# Altium schematic sheet 02 Connector.SchDoc
size A1; Revision: V1.2; SheetNumber: 2; SheetTotal: 11
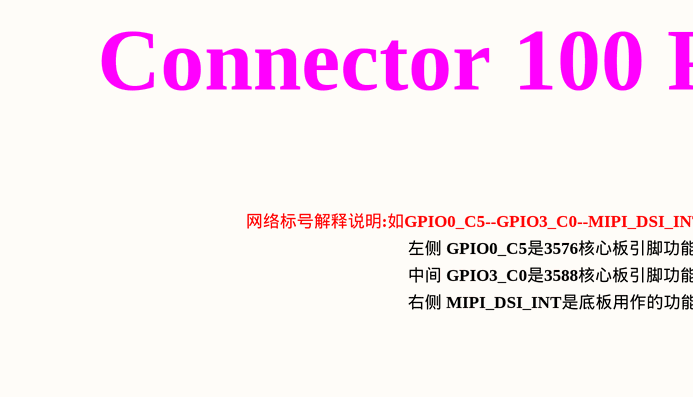
[diagram p0: 02 Connector.SchDoc, top left]
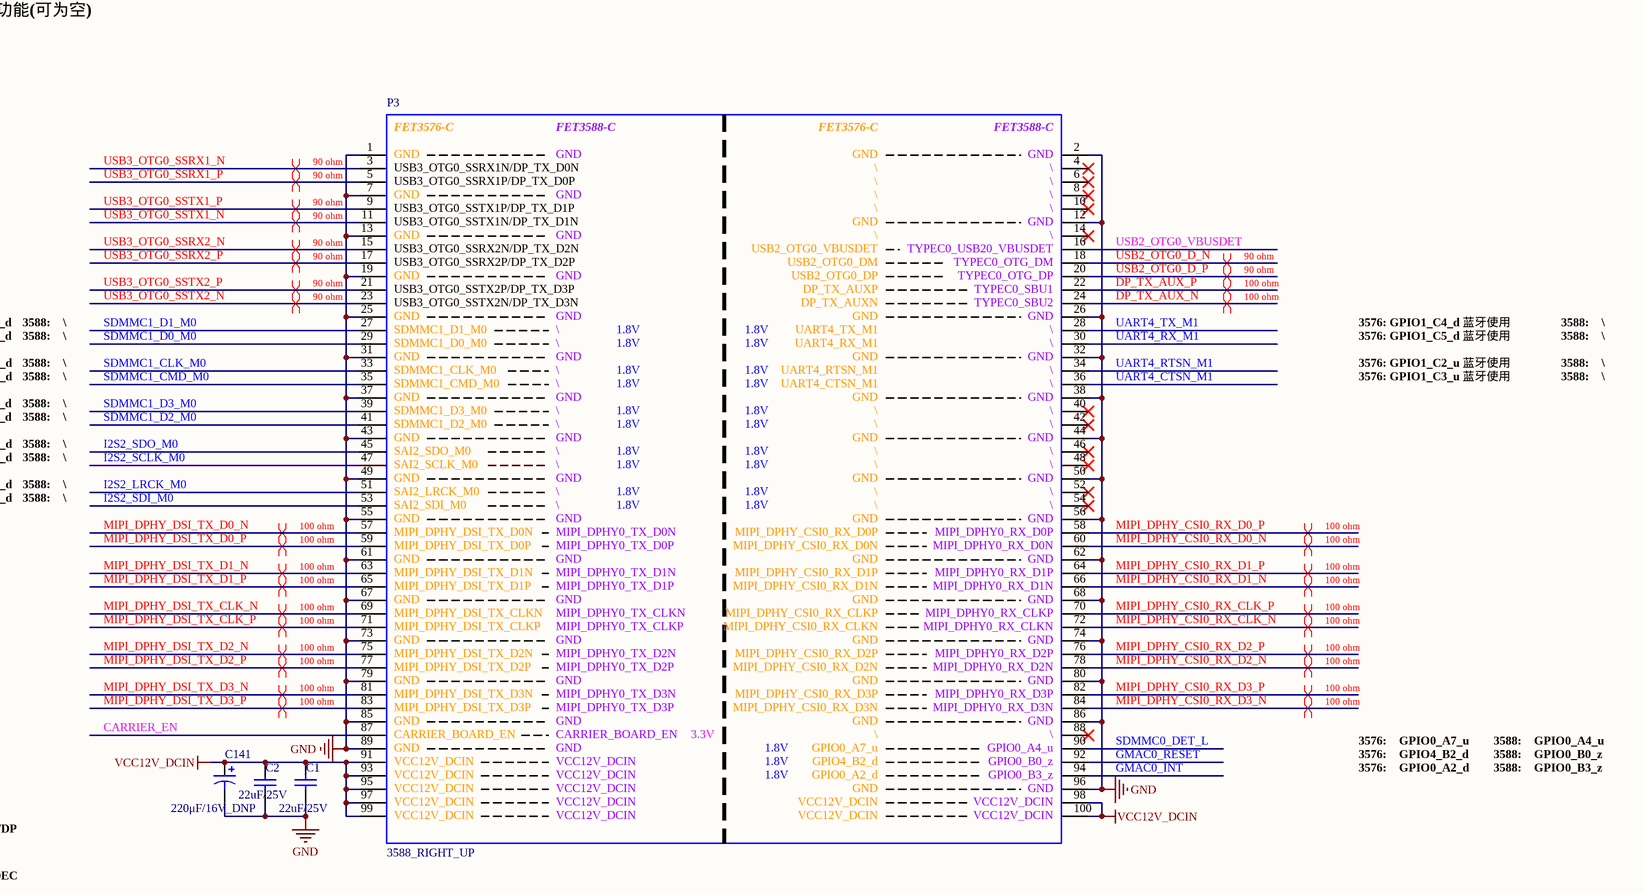
[diagram p1: 02 Connector.SchDoc, top right]
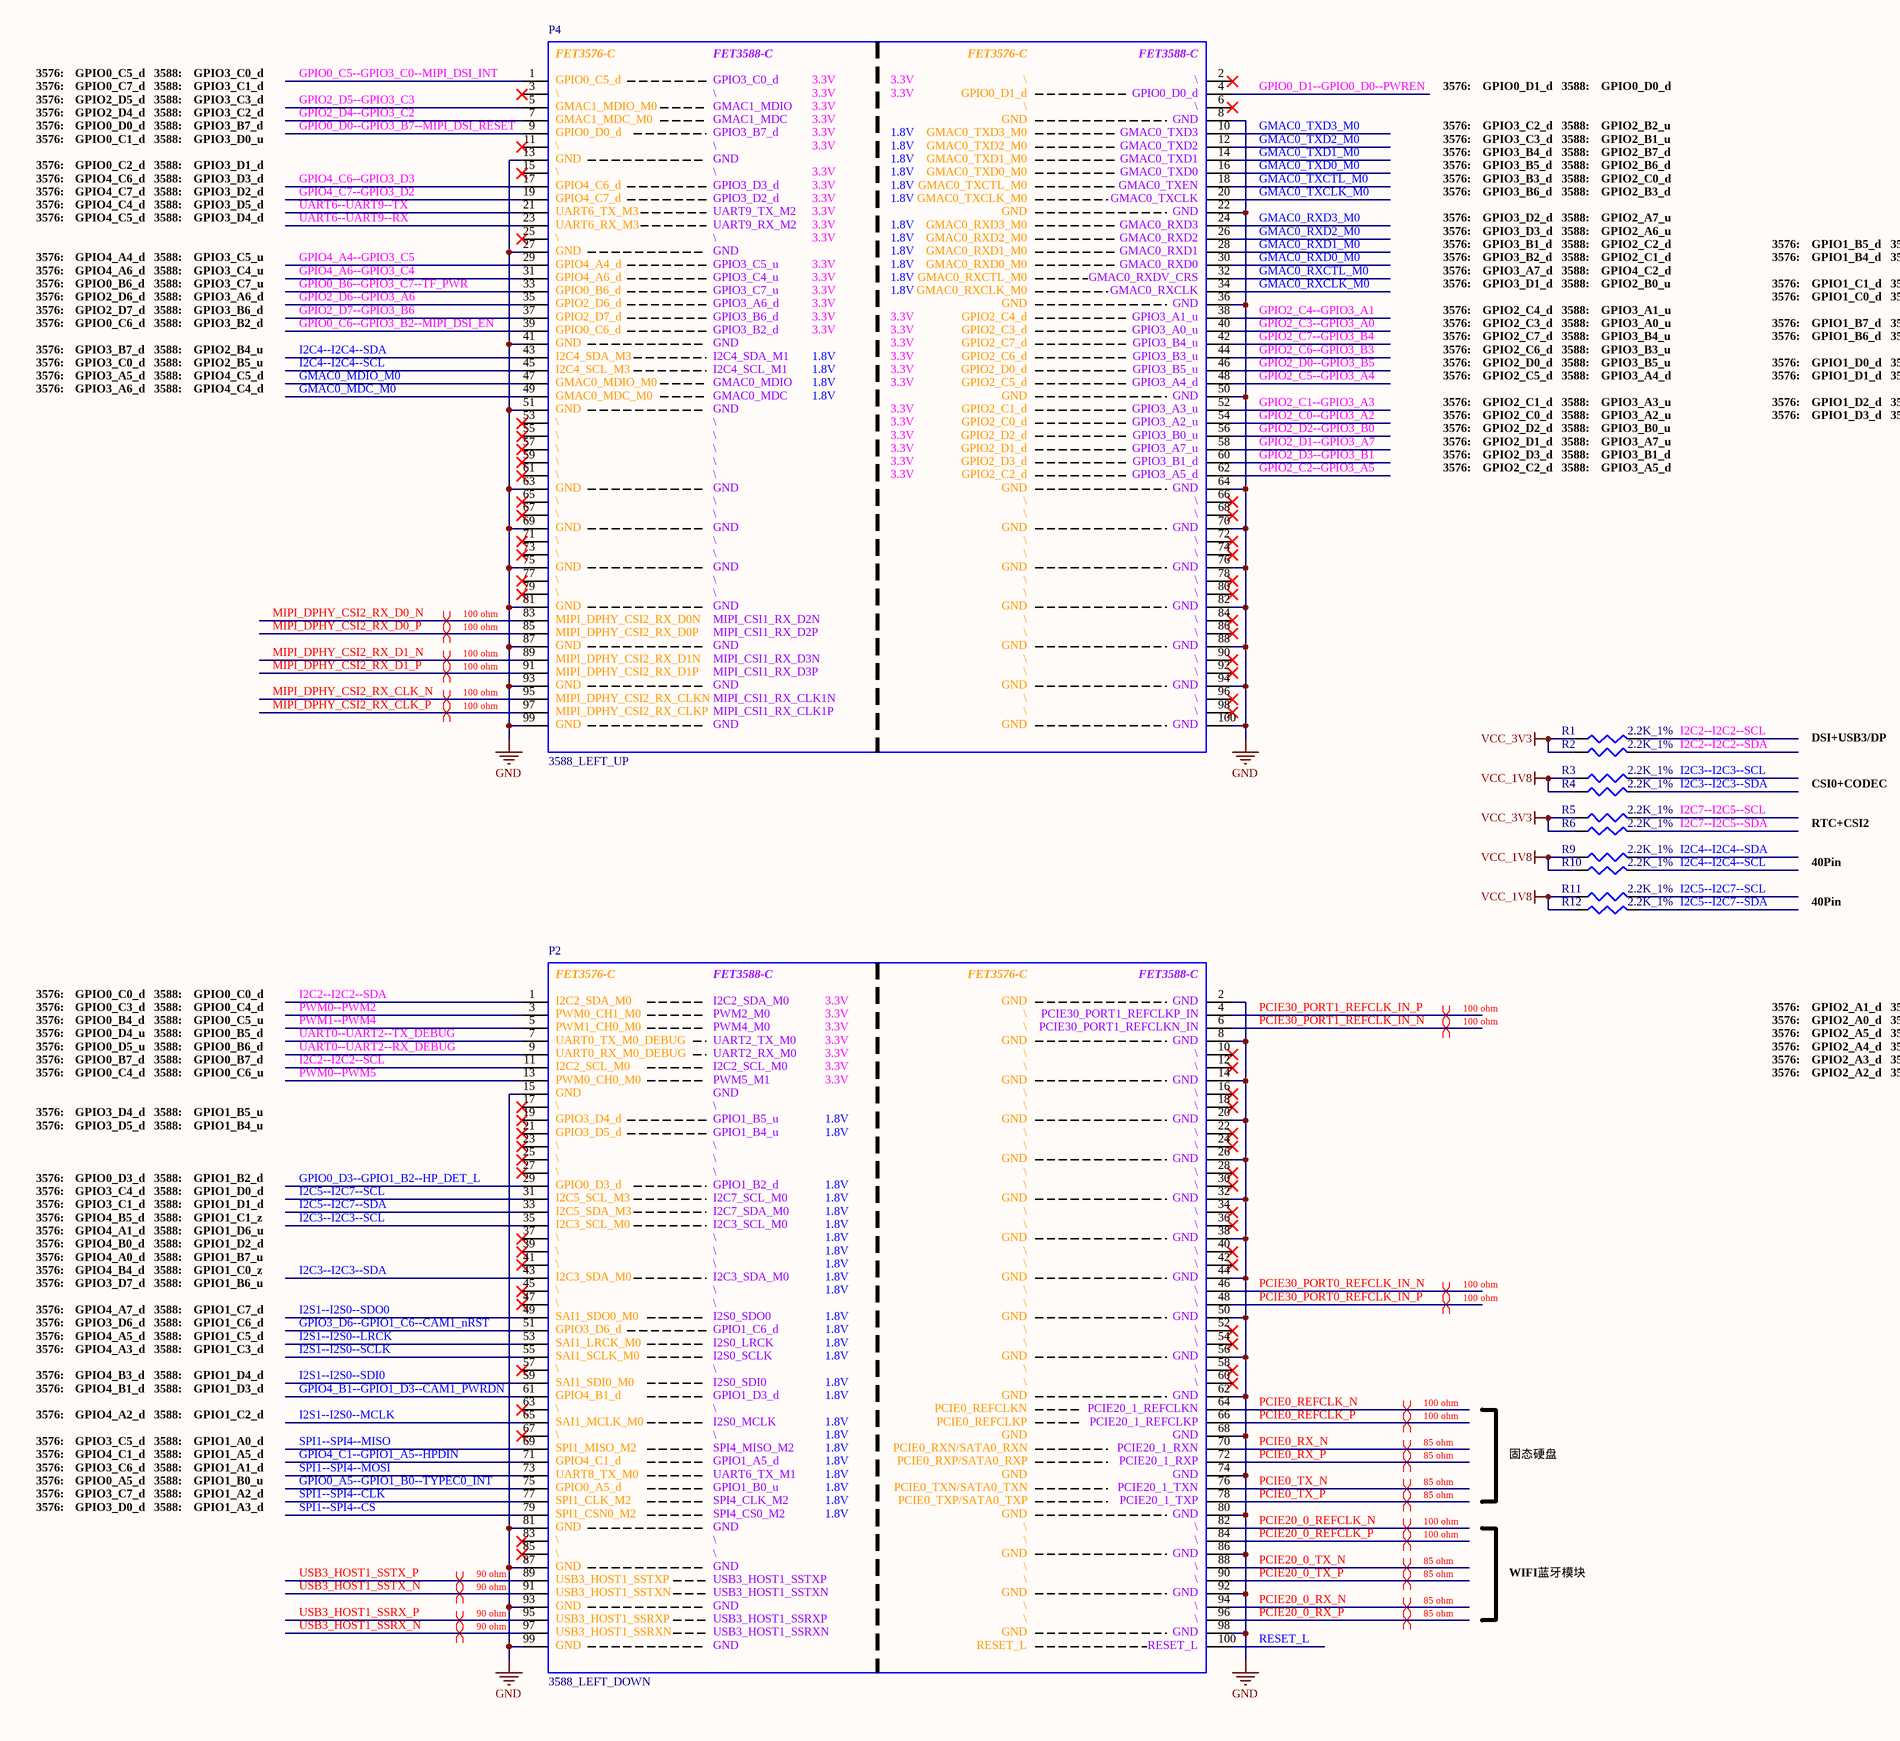
[diagram p2: 02 Connector.SchDoc, bottom left]
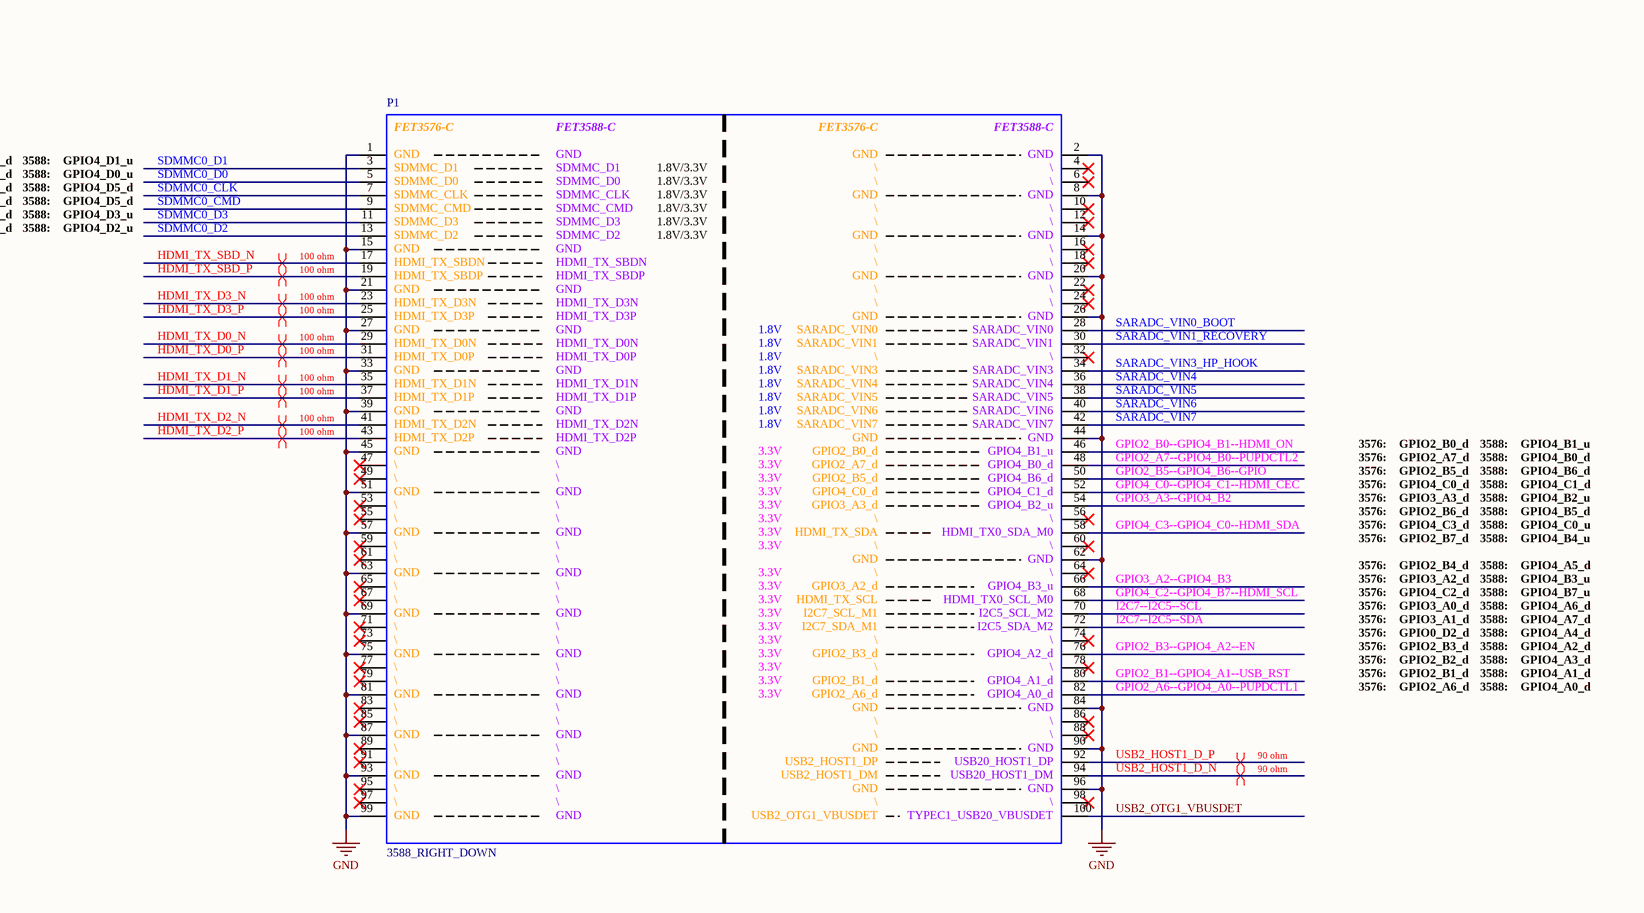
[diagram p3: 02 Connector.SchDoc, bottom right]

## Parts
C1  22uF/25V  [1206C]
C2  22uF/25V  [1206C]
C141  220μF/16V_DNP  [CAP SMT_6.3x7.7]
P1  3588_RIGHT_DOWN  [SOCKET_100PIN_0.4MM_F]
P2  3588_LEFT_DOWN  [SOCKET_100PIN_0.4MM_F]
P3  3588_RIGHT_UP  [SOCKET_100PIN_0.4MM_F]
P4  3588_LEFT_UP  [SOCKET_100PIN_0.4MM_F]
R1  2.2K_1%  [0402R]
R2  2.2K_1%  [0402R]
R3  2.2K_1%  [0402R]
R4  2.2K_1%  [0402R]
R5  2.2K_1%  [0402R]
R6  2.2K_1%  [0402R]
R9  2.2K_1%  [0402R]
R10  2.2K_1%  [0402R]
R11  2.2K_1%  [0402R]
R12  2.2K_1%  [0402R]

## Nets
GND: C1.1 C2.1 C141.2 P1.1(GND) P1.2(GND) P1.8(GND) P1.14(GND) P1.15(GND) P1.20(GND) P1.21(GND) P1.26(GND) P1.27(GND) P1.33(GND) P1.39(GND) P1.44(GND) P1.45(GND) P1.51(GND) P1.57(GND) P1.62(GND) P1.63(GND) P1.69(GND) P1.75(GND) P1.81(GND) P1.84(GND) P1.87(GND) P1.90(GND) P1.93(GND) P1.96(GND) P1.99(GND) P2.2(GND) P2.8(GND) P2.14(GND) P2.15(GND) P2.20(GND) P2.26(GND) P2.32(GND) P2.38(GND) P2.44(GND) P2.50(GND) P2.56(GND) P2.62(GND) P2.68(GND) P2.74(GND) P2.80(GND) P2.81(GND) P2.86(GND) P2.87(GND) P2.92(GND) P2.93(GND) P2.98(GND) P2.99(GND) P3.1(GND) P3.2(GND) P3.7(GND) P3.12(GND) P3.13(GND) P3.19(GND) P3.25(GND) P3.26(GND) P3.31(GND) P3.32(GND) P3.37(GND) P3.38(GND) P3.43(GND) P3.44(GND) P3.49(GND) P3.50(GND) P3.55(GND) P3.56(GND) P3.61(GND) P3.62(GND) P3.67(GND) P3.68(GND) P3.73(GND) P3.74(GND) P3.79(GND) P3.80(GND) P3.85(GND) P3.86(GND) P3.89(GND) P3.96(GND) P4.8(GND) P4.13(GND) P4.22(GND) P4.27(GND) P4.36(GND) P4.41(GND) P4.50(GND) P4.51(GND) P4.63(GND) P4.64(GND) P4.69(GND) P4.70(GND) P4.75(GND) P4.76(GND) P4.81(GND) P4.82(GND) P4.87(GND) P4.88(GND) P4.93(GND) P4.94(GND) P4.99(GND) P4.100(GND)
VCC12V_DCIN: C1.2 C2.2 C141.1 P3.91(VCC12V_DCIN) P3.93(VCC12V_DCIN) P3.95(VCC12V_DCIN) P3.97(VCC12V_DCIN) P3.98(VCC12V_DCIN) P3.99(VCC12V_DCIN) P3.100(VCC12V_DCIN)
VCC_1V8: R3.1 R4.1 R9.1 R10.1 R11.1 R12.1
VCC_3V3: R1.1 R2.1 R5.1 R6.1
CARRIER_EN: P3.87(CARRIER_BOARD_EN)
DP_TX_AUX_N: P3.24(DP_TX_AUXN)
DP_TX_AUX_P: P3.22(DP_TX_AUXP)
GMAC0_INT: P3.94(GPIO0_A2_d)
GMAC0_MDC_M0: P4.49(GMAC0_MDC_M0)
GMAC0_MDIO_M0: P4.47(GMAC0_MDIO_M0)
GMAC0_RESET: P3.92(GPIO4_B2_d)
GMAC0_RXCLK_M0: P4.34(GMAC0_RXCLK_M0)
GMAC0_RXCTL_M0: P4.32(GMAC0_RXCTL_M0)
GMAC0_RXD0_M0: P4.30(GMAC0_RXD0_M0)
GMAC0_RXD1_M0: P4.28(GMAC0_RXD1_M0)
GMAC0_RXD2_M0: P4.26(GMAC0_RXD2_M0)
GMAC0_RXD3_M0: P4.24(GMAC0_RXD3_M0)
GMAC0_TXCLK_M0: P4.20(GMAC0_TXCLK_M0)
GMAC0_TXCTL_M0: P4.18(GMAC0_TXCTL_M0)
GMAC0_TXD0_M0: P4.16(GMAC0_TXD0_M0)
GMAC0_TXD1_M0: P4.14(GMAC0_TXD1_M0)
GMAC0_TXD2_M0: P4.12(GMAC0_TXD2_M0)
GMAC0_TXD3_M0: P4.10(GMAC0_TXD3_M0)
GPIO0_A5--GPIO1_B0--TYPEC0_INT: P2.75(GPIO0_A5_d)
GPIO0_B6--GPIO3_C7--TF_PWR: P4.33(GPIO0_B6_d)
GPIO0_C5--GPIO3_C0--MIPI_DSI_INT: P4.1(GPIO0_C5_d)
GPIO0_C6--GPIO3_B2--MIPI_DSI_EN: P4.39(GPIO0_C6_d)
GPIO0_D0--GPIO3_B7--MIPI_DSI_RESET: P4.9(GPIO0_D0_d)
GPIO0_D1--GPIO0_D0--PWREN: P4.4(GPIO0_D1_d)
GPIO0_D3--GPIO1_B2--HP_DET_L: P2.29(GPIO0_D3_d_1V8)
GPIO2_A6--GPIO4_A0--PUPDCTL1: P1.82(TYPEC_DPTX_AUX_PUPDCTL1)
GPIO2_A7--GPIO4_B0--PUPDCTL2: P1.48(TYPEC_DPTX_AUX_PUPDCTL2)
GPIO2_B0--GPIO4_B1--HDMI_ON: P1.46(HDMI_TX_ON_H)
GPIO2_B1--GPIO4_A1--USB_RST: P1.80(GPIO2_B1_d)
GPIO2_B3--GPIO4_A2--EN: P1.76(GPIO2_B3_d)
GPIO2_B5--GPIO4_B6--GPIO: P1.50(GPIO2_B5_d)
GPIO2_C0--GPIO3_A2: P4.54(GMAC1_RXD2_M0)
GPIO2_C1--GPIO3_A3: P4.52(GMAC1_RXD3_M0)
GPIO2_C2--GPIO3_A5: P4.62(GMAC1_RXCLK_M0)
GPIO2_C3--GPIO3_A0: P4.40(GMAC1_TXD2_M0)
GPIO2_C4--GPIO3_A1: P4.38(GMAC1_TXD3_M0)
GPIO2_C5--GPIO3_A4: P4.48(GMAC1_TXCLK_M0)
GPIO2_C6--GPIO3_B3: P4.44(GMAC1_TXD0_M0)
GPIO2_C7--GPIO3_B4: P4.42(GMAC1_TXD1_M0)
GPIO2_D0--GPIO3_B5: P4.46(GMAC1_TXCTL_M0)
GPIO2_D1--GPIO3_A7: P4.58(GMAC1_RXD0_M0)
GPIO2_D2--GPIO3_B0: P4.56(GMAC1_RXD1_M0)
GPIO2_D3--GPIO3_B1: P4.60(GMAC1_RXCTL_M0)
GPIO2_D4--GPIO3_C2: P4.7(GMAC1_MDC_M0)
GPIO2_D5--GPIO3_C3: P4.5(GMAC1_MDIO_M0)
GPIO2_D6--GPIO3_A6: P4.35(ETH_CLK1_25M_OUT_M0)
GPIO2_D7--GPIO3_B6: P4.37(ETH1_MCLK_M0)
GPIO3_A2--GPIO4_B3: P1.66(CAN1_TX_M3)
GPIO3_A3--GPIO4_B2: P1.54(CAN1_RX_M3)
GPIO3_D6--GPIO1_C6--CAM1_nRST: P2.51(GPIO3_D6_d)
GPIO4_A4--GPIO3_C5: P4.29(CAN0_TX_M2_3V3)
GPIO4_A6--GPIO3_C4: P4.31(CAN0_RX_M2_3V3)
GPIO4_B1--GPIO1_D3--CAM1_PWRDN: P2.61(UART5_RX_M1)
GPIO4_C0--GPIO4_C1--HDMI_CEC: P1.52(HDMI_TX_CEC_M0)
GPIO4_C1--GPIO1_A5--HPDIN: P2.71(HDMI_TX_HPDIN_M0_1V8)
GPIO4_C2--GPIO4_B7--HDMI_SCL: P1.68(HDMI_TX_SCL)
GPIO4_C3--GPIO4_C0--HDMI_SDA: P1.58(HDMI_TX_SDA)
GPIO4_C6--GPIO3_D3: P4.17(GPIO4_C6_d)
GPIO4_C7--GPIO3_D2: P4.19(GPIO4_C7_d)
HDMI_TX_D0_N: P1.29(HDMI_TX_D0N)
HDMI_TX_D0_P: P1.31(HDMI_TX_D0P)
HDMI_TX_D1_N: P1.35(HDMI_TX_D1N)
HDMI_TX_D1_P: P1.37(HDMI_TX_D1P)
HDMI_TX_D2_N: P1.41(HDMI_TX_D2N)
HDMI_TX_D2_P: P1.43(HDMI_TX_D2P)
HDMI_TX_D3_N: P1.23(HDMI_TX_D3N)
HDMI_TX_D3_P: P1.25(HDMI_TX_D3P)
HDMI_TX_SBD_N: P1.17(HDMI_TX_SBDN)
HDMI_TX_SBD_P: P1.19(HDMI_TX_SBDP)
I2C2--I2C2--SCL: P2.11(I2C2_SCL_M0) R1.2
I2C2--I2C2--SDA: P2.1(I2C2_SDA_M0) R2.2
I2C3--I2C3--SCL: P2.35(I2C3_SCL_M0) R3.2
I2C3--I2C3--SDA: P2.43(I2C3_SDA_M0) R4.2
I2C4--I2C4--SCL: P4.45(I2C4_SCL_M3) R10.2
I2C4--I2C4--SDA: P4.43(I2C4_SDA_M3) R9.2
I2C5--I2C7--SCL: P2.31(I2C5_SCL_M3) R11.2
I2C5--I2C7--SDA: P2.33(I2C5_SDA_M3) R12.2
I2C7--I2C5--SCL: P1.70(I2C7_SCL_M1) R5.2
I2C7--I2C5--SDA: P1.72(I2C7_SDA_M1) R6.2
I2S1--I2S0--LRCK: P2.53(SAI1_LRCK_M0)
I2S1--I2S0--MCLK: P2.65(SAI1_MCLK_M0)
I2S1--I2S0--SCLK: P2.55(SAI1_SCLK_M0)
I2S1--I2S0--SDI0: P2.59(SAI1_SDI0_M0)
I2S1--I2S0--SDO0: P2.49(SAI1_SDO0_M0)
I2S2_LRCK_M0: P3.51(SAI2_LRCK_M0)
I2S2_SCLK_M0: P3.47(SAI2_SCLK_M0)
I2S2_SDI_M0: P3.53(SAI2_SDI_M0)
I2S2_SDO_M0: P3.45(SAI2_SDO_M0)
MIPI_DPHY_CSI0_RX_CLK_N: P3.72(MIPI_DPHY_CSI0_RX_CLKN)
MIPI_DPHY_CSI0_RX_CLK_P: P3.70(MIPI_DPHY_CSI0_RX_CLKP)
MIPI_DPHY_CSI0_RX_D0_N: P3.60(MIPI_DPHY_CSI0_RX_D0N)
MIPI_DPHY_CSI0_RX_D0_P: P3.58(MIPI_DPHY_CSI0_RX_D0P)
MIPI_DPHY_CSI0_RX_D1_N: P3.66(MIPI_DPHY_CSI0_RX_D1N)
MIPI_DPHY_CSI0_RX_D1_P: P3.64(MIPI_DPHY_CSI0_RX_D1P)
MIPI_DPHY_CSI0_RX_D2_N: P3.78(MIPI_DPHY_CSI0_RX_D2N)
MIPI_DPHY_CSI0_RX_D2_P: P3.76(MIPI_DPHY_CSI0_RX_D2P)
MIPI_DPHY_CSI0_RX_D3_N: P3.84(MIPI_DPHY_CSI0_RX_D3N)
MIPI_DPHY_CSI0_RX_D3_P: P3.82(MIPI_DPHY_CSI0_RX_D3P)
MIPI_DPHY_CSI2_RX_CLK_N: P4.95(MIPI_DPHY_CSI2_RX_CLKN)
MIPI_DPHY_CSI2_RX_CLK_P: P4.97(MIPI_DPHY_CSI2_RX_CLKP)
MIPI_DPHY_CSI2_RX_D0_N: P4.83(MIPI_DPHY_CSI2_RX_D0N)
MIPI_DPHY_CSI2_RX_D0_P: P4.85(MIPI_DPHY_CSI2_RX_D0P)
MIPI_DPHY_CSI2_RX_D1_N: P4.89(MIPI_DPHY_CSI2_RX_D1N)
MIPI_DPHY_CSI2_RX_D1_P: P4.91(MIPI_DPHY_CSI2_RX_D1P)
MIPI_DPHY_DSI_TX_CLK_N: P3.69(MIPI_DPHY_DSI_TX_CLKN)
MIPI_DPHY_DSI_TX_CLK_P: P3.71(MIPI_DPHY_DSI_TX_CLKP)
MIPI_DPHY_DSI_TX_D0_N: P3.57(MIPI_DPHY_DSI_TX_D0N)
MIPI_DPHY_DSI_TX_D0_P: P3.59(MIPI_DPHY_DSI_TX_D0P)
MIPI_DPHY_DSI_TX_D1_N: P3.63(MIPI_DPHY_DSI_TX_D1N)
MIPI_DPHY_DSI_TX_D1_P: P3.65(MIPI_DPHY_DSI_TX_D1P)
MIPI_DPHY_DSI_TX_D2_N: P3.75(MIPI_DPHY_DSI_TX_D2N)
MIPI_DPHY_DSI_TX_D2_P: P3.77(MIPI_DPHY_DSI_TX_D2P)
MIPI_DPHY_DSI_TX_D3_N: P3.81(MIPI_DPHY_DSI_TX_D3N)
MIPI_DPHY_DSI_TX_D3_P: P3.83(MIPI_DPHY_DSI_TX_D3P)
PCIE0_REFCLK_N: P2.64(PCIE0_REFCLKN)
PCIE0_REFCLK_P: P2.66(PCIE0_REFCLKP)
PCIE0_RX_N: P2.70(PCIE0_RXN/SATA0_RXN)
PCIE0_RX_P: P2.72(PCIE0_RXP/SATA0_RXP)
PCIE0_TX_N: P2.76(PCIE0_TXN/SATA0_TXN)
PCIE0_TX_P: P2.78(PCIE0_TXP/SATA0_TXP)
PCIE20_0_REFCLK_N: P2.82
PCIE20_0_REFCLK_P: P2.84
PCIE20_0_RX_N: P2.94
PCIE20_0_RX_P: P2.96
PCIE20_0_TX_N: P2.88
PCIE20_0_TX_P: P2.90
PCIE30_PORT0_REFCLK_IN_N: P2.46
PCIE30_PORT0_REFCLK_IN_P: P2.48
PCIE30_PORT1_REFCLK_IN_N: P2.6
PCIE30_PORT1_REFCLK_IN_P: P2.4
PWM0--PWM2: P2.3(PWM0_CH1_M0)
PWM0--PWM5: P2.13(PWM0_CH0_M0)
PWM1--PWM4: P2.5(PWM1_CH0_M0)
RESET_L: P2.100(RESET_L)
SARADC_VIN0_BOOT: P1.28(SARADC_VIN0_BOOT)
SARADC_VIN1_RECOVERY: P1.30(SARADC_VIN1_KEY/RECOVERY)
SARADC_VIN3_HP_HOOK: P1.34(SARADC_VIN3_HP_HOOK)
SARADC_VIN4: P1.36(SARADC_VIN4)
SARADC_VIN5: P1.38(SARADC_VIN5)
SARADC_VIN6: P1.40(SARADC_VIN6)
SARADC_VIN7: P1.42(SARADC_VIN7_LCD_ID)
SDMMC0_CLK: P1.7(SDMMC0_CLK)
SDMMC0_CMD: P1.9(SDMMC0_CMD)
SDMMC0_D0: P1.5(SDMMC0_D0)
SDMMC0_D1: P1.3(SDMMC0_D1)
SDMMC0_D2: P1.13(SDMMC0_D2)
SDMMC0_D3: P1.11(SDMMC0_D3)
SDMMC0_DET_L: P3.90(SDMMC0_DET_L)
SDMMC1_CLK_M0: P3.33(SDMMC1_CLK_M0)
SDMMC1_CMD_M0: P3.35(SDMMC1_CMD_M0)
SDMMC1_D0_M0: P3.29(SDMMC1_D0_M0)
SDMMC1_D1_M0: P3.27(SDMMC1_D1_M0)
SDMMC1_D2_M0: P3.41(SDMMC1_D2_M0)
SDMMC1_D3_M0: P3.39(SDMMC1_D3_M0)
SPI1--SPI4--CLK: P2.77(UART8_RTSN_M0)
SPI1--SPI4--CS: P2.79(UART8_CTSN_M0)
SPI1--SPI4--MISO: P2.69(UART8_RX_M0)
SPI1--SPI4--MOSI: P2.73(UART8_TX_M0)
UART0--UART2--RX_DEBUG: P2.9(UART0_RX_M0_DEBUG)
UART0--UART2--TX_DEBUG: P2.7(UART0_TX_M0_DEBUG)
UART4_CTSN_M1: P3.36(UART4_CTSN_M1)
UART4_RTSN_M1: P3.34(UART4_RTSN_M1)
UART4_RX_M1: P3.30(UART4_RX_M1)
UART4_TX_M1: P3.28(UART4_TX_M1)
UART6--UART9--RX: P4.23(UART6_RX_M3)
UART6--UART9--TX: P4.21(UART6_TX_M3)
USB2_HOST1_D_N: P1.94(USB2_HOST1_DM)
USB2_HOST1_D_P: P1.92(USB2_HOST1_DP)
USB2_OTG0_D_N: P3.18(USB2_OTG0_DM)
USB2_OTG0_D_P: P3.20(USB2_OTG0_DP)
USB2_OTG0_VBUSDET: P3.16(USB2_OTG0_VBUSDET)
USB2_OTG1_VBUSDET: P1.100(USB2_OTG1_VBUSDET)
USB3_HOST1_SSRX_N: P2.97(PCIE1_RXN/USB3_HOST1_SSRXN)
USB3_HOST1_SSRX_P: P2.95(PCIE1_RXP/USB3_HOST1_SSRXP)
USB3_HOST1_SSTX_N: P2.91(PCIE1_TXN/USB3_HOST1_SSTXN)
USB3_HOST1_SSTX_P: P2.89(PCIE1_TXP/USB3_HOST1_SSTXP)
USB3_OTG0_SSRX1_N: P3.3(USB3_OTG0_SSRX1N/DP_TX_D0N)
USB3_OTG0_SSRX1_P: P3.5(USB3_OTG0_SSRX1P/DP_TX_D0P)
USB3_OTG0_SSRX2_N: P3.15(USB3_OTG0_SSRX2N/DP_TX_D2N)
USB3_OTG0_SSRX2_P: P3.17(USB3_OTG0_SSRX2P/DP_TX_D2P)
USB3_OTG0_SSTX1_N: P3.11(USB3_OTG0_SSTX1N/DP_TX_D1N)
USB3_OTG0_SSTX1_P: P3.9(USB3_OTG0_SSTX1P/DP_TX_D1P)
USB3_OTG0_SSTX2_N: P3.23(USB3_OTG0_SSTX2N/DP_TX_D3N)
USB3_OTG0_SSTX2_P: P3.21(USB3_OTG0_SSTX2P/DP_TX_D3P)

Not connected (* = marked no-connect by the designer): P1 4* 6* 10* 12* 16* 18* 22* 24* 32(SARADC_VIN2_HW_ID)* 47* 49* 53* 55* 56(I2C8_SCL_M2)* 59* 60(I2C8_SDA_M2)* 61* 64(PCIE0_PERSTn)* 65* 67* 71* 73* 74(PCIE0_WAKEn_M0)* 77* 78(PCIE0_CLKREQn_M0)* 79* 83* 85* 86* 88* 89* 91* 95* 97* 98(USB2_OTG1_ID)*; P2 10* 12* 16* 17* 18* 19(GPIO3_D4_d)* 21(GPIO3_D5_d)* 22* 23* 24* 25* 27* 28* 30* 34* 36* 37(CAM_CLK2_OUT_M0)* 39(UART5_TX_M1)* 40* 41(CAM_CLK1_OUT_M0)* 42* 45(CAM_CLK0_OUT_M0)* 47* 52* 54* 57* 58* 60* 63(GND)* 67(GPIO0_A0_d)* 83(PCIE1_REFCLKP)* 85(PCIE1_REFCLKN)*; P3 4* 6* 8* 10* 14(USB2_OTG0_ID)* 40(WIFI_REG_ON_H)* 42(BT_REG_ON_H)* 46(HOST_WAKE_BT_H)* 48(GPIO1_D5_d)* 52(WIFI_WAKE_HOST_H)* 54(BT_WAKE_HOST_H)* 88(PWRON_L)*; P4 2(PWM1_CH1_M0)* 3(GPIO0_C7_d)* 6* 11(I2C0_SCL_M1)* 15(I2C0_SDA_M1)* 25(WIFI_PEN)* 53* 55* 57(ETH_CLK0_25M_OUT_M0)* 59* 61(ETH0_MCLK_M0)* 65(MIPI_DPHY_CSI1_RX_D0N)* 66(MIPI_DPHY_CSI3_RX_D0P)* 67(MIPI_DPHY_CSI1_RX_D0P)* 68(MIPI_DPHY_CSI3_RX_D0N)* 71(MIPI_DPHY_CSI1_RX_D1N)* 72(MIPI_DPHY_CSI3_RX_D1P)* 73(MIPI_DPHY_CSI1_RX_D1P)* 74(MIPI_DPHY_CSI3_RX_D1N)* 77(MIPI_DPHY_CSI1_RX_CLKN)* 78(MIPI_DPHY_CSI3_RX_CLKP)* 79(MIPI_DPHY_CSI1_RX_CLKP)* 80(MIPI_DPHY_CSI3_RX_CLKN)* 84(MIPI_DPHY_CSI4_RX_D0P)* 86(MIPI_DPHY_CSI4_RX_D0N)* 90(MIPI_DPHY_CSI4_RX_D1P)* 92(MIPI_DPHY_CSI4_RX_D1N)* 96(MIPI_DPHY_CSI4_RX_CLKP)* 98(MIPI_DPHY_CSI4_RX_CLKN)*

## Layout directives
differential pair; differential pair class 100 ohm: DP_TX_AUX_N, DP_TX_AUX_P, HDMI_TX_D0_N, HDMI_TX_D0_P, HDMI_TX_D1_N, HDMI_TX_D1_P, HDMI_TX_D2_N, HDMI_TX_D2_P, HDMI_TX_D3_N, HDMI_TX_D3_P, HDMI_TX_SBD_N, HDMI_TX_SBD_P, MIPI_DPHY_CSI0_RX_CLK_N, MIPI_DPHY_CSI0_RX_CLK_P, MIPI_DPHY_CSI0_RX_D0_N, MIPI_DPHY_CSI0_RX_D0_P, MIPI_DPHY_CSI0_RX_D1_N, MIPI_DPHY_CSI0_RX_D1_P, MIPI_DPHY_CSI0_RX_D2_N, MIPI_DPHY_CSI0_RX_D2_P, MIPI_DPHY_CSI0_RX_D3_N, MIPI_DPHY_CSI0_RX_D3_P, MIPI_DPHY_CSI2_RX_CLK_N, MIPI_DPHY_CSI2_RX_CLK_P, MIPI_DPHY_CSI2_RX_D0_N, MIPI_DPHY_CSI2_RX_D0_P, MIPI_DPHY_CSI2_RX_D1_N, MIPI_DPHY_CSI2_RX_D1_P, MIPI_DPHY_DSI_TX_CLK_N, MIPI_DPHY_DSI_TX_CLK_P, MIPI_DPHY_DSI_TX_D0_N, MIPI_DPHY_DSI_TX_D0_P, MIPI_DPHY_DSI_TX_D1_N, MIPI_DPHY_DSI_TX_D1_P, MIPI_DPHY_DSI_TX_D2_N, MIPI_DPHY_DSI_TX_D2_P, MIPI_DPHY_DSI_TX_D3_N, MIPI_DPHY_DSI_TX_D3_P, PCIE0_REFCLK_N, PCIE0_REFCLK_P, PCIE20_0_REFCLK_N, PCIE20_0_REFCLK_P, PCIE30_PORT0_REFCLK_IN_N, PCIE30_PORT0_REFCLK_IN_P, PCIE30_PORT1_REFCLK_IN_N, PCIE30_PORT1_REFCLK_IN_P
differential pair; differential pair class 90 ohm: USB2_HOST1_D_N, USB2_HOST1_D_P, USB2_OTG0_D_N, USB2_OTG0_D_P, USB3_HOST1_SSRX_N, USB3_HOST1_SSRX_P, USB3_HOST1_SSTX_N, USB3_HOST1_SSTX_P, USB3_OTG0_SSRX1_N, USB3_OTG0_SSRX1_P, USB3_OTG0_SSRX2_N, USB3_OTG0_SSRX2_P, USB3_OTG0_SSTX1_N, USB3_OTG0_SSTX1_P, USB3_OTG0_SSTX2_N, USB3_OTG0_SSTX2_P
differential pair; differential pair class 85 ohm: PCIE0_RX_N, PCIE0_RX_P, PCIE0_TX_N, PCIE0_TX_P, PCIE20_0_RX_N, PCIE20_0_RX_P, PCIE20_0_TX_N, PCIE20_0_TX_P

## Notes on the sheet
- Connector 100 Pin * 4
- 网络标号解释说明:如GPIO0_C5--GPIO3_C0--MIPI_DSI_INT
- 左侧 GPIO0_C5是3576核心板引脚功能
- 中间 GPIO3_C0是3588核心板引脚功能
- 右侧 MIPI_DSI_INT是底板用作的功能(可为空)
- 3576:
- GPIO0_C5_d
- GPIO2_D5_d
- GPIO2_D4_d
- GPIO0_D0_d
- GPIO0_C7_d
- 3588:
- GPIO3_C0_d
- GPIO3_C3_d
- GPIO3_C2_d
- GPIO3_B7_d
- GPIO3_C1_d
- GPIO0_D1_d
- GPIO2_B2_u
- GPIO0_C1_d
- GPIO0_C2_d
- GPIO4_C6_d
- GPIO4_C7_d
- GPIO3_D0_u
- GPIO3_D1_d
- GPIO3_D3_d
- GPIO3_D2_d
- GPIO3_B4_d
- GPIO3_B5_d
- GPIO3_B3_d
- GPIO3_B6_d
- GPIO2_B1_u
- GPIO2_B7_d
- GPIO2_B6_d
- GPIO2_C0_d
- GPIO2_B3_d
- GPIO4_C4_d
- GPIO4_C5_d
- GPIO4_A4_d
- GPIO3_D5_d
- GPIO3_D4_d
- GPIO3_C5_u
- GPIO3_B1_d
- GPIO3_B2_d
- GPIO2_A7_u
- GPIO2_A6_u
- GPIO2_C2_d
- GPIO2_C1_d
- GPIO1_B5_d
- GPIO1_B4_d
- \
- 3576: GPIO1_C4_d 蓝牙使用
- 3576: GPIO1_C5_d 蓝牙使用
- GPIO4_A6_d
- GPIO0_B6_d
- GPIO2_D6_d
- GPIO2_D7_d
- GPIO0_C6_d
- GPIO3_C4_u
- GPIO3_C7_u
- GPIO3_A6_d
- GPIO2_C4_d
- GPIO2_C3_d
- GPIO3_A7_d
- GPIO3_A1_u
- GPIO3_A0_u
- GPIO4_C2_d
- GPIO2_B0_u
- GPIO1_C1_d
- GPIO1_C0_d
- GPIO1_B7_d
- 3576: GPIO1_C3_u 蓝牙使用
- 3576: GPIO1_C2_u 蓝牙使用
- GPIO3_A5_d
- GPIO2_B4_u
- GPIO2_B5_u
- GPIO2_C7_d
- GPIO2_C6_d
- GPIO2_D0_d
- GPIO2_C5_d
- GPIO3_B4_u
- GPIO3_B3_u
- GPIO3_B5_u
- GPIO3_A4_d
- GPIO1_B6_d
- GPIO1_D0_d
- GPIO1_D1_d
- GPIO2_D2_d
- GPIO2_D1_d
- GPIO2_D3_d
- GPIO3_A3_u
- GPIO3_A2_u
- GPIO3_B0_u
- GPIO3_A7_u
- GPIO1_D2_d
- GPIO1_D3_d
- GPIO0_A7_u
- GPIO0_A4_u
- GPIO4_B2_d
- GPIO0_A2_d
- GPIO0_B0_z
- GPIO0_B3_z
- CSI0+CODEC
- DSI+USB3/DP
- RTC+CSI2
- 40Pin
- GPIO0_C0_d
- GPIO0_C3_d
- GPIO0_B4_d
- GPIO0_D4_u
- GPIO0_D5_u
- GPIO0_C4_d
- GPIO0_C5_u
- GPIO0_B5_d
- GPIO2_A1_d
- GPIO2_A0_d
- GPIO2_A5_d
- GPIO2_A4_d
- GPIO4_D1_u
- GPIO4_D0_u
- GPIO4_D5_d
- GPIO0_B7_d
- GPIO0_C6_u
- GPIO1_B5_u
- GPIO2_A3_d
- GPIO2_A2_d
- GPIO4_D3_u
- GPIO4_D2_u
- GPIO0_D3_d
- GPIO1_B2_d
- GPIO1_B4_u
- GPIO3_C4_d
- GPIO4_B5_d
- GPIO4_B0_d
- GPIO4_A1_d
- GPIO1_C1_z
- GPIO1_D6_u
- GPIO4_B4_d
- GPIO4_A7_d
- GPIO4_A0_d
- GPIO3_D7_d
- GPIO1_C0_z
- GPIO1_C7_d
- GPIO1_B7_u
- GPIO1_B6_u
- GPIO2_B0_d
- GPIO2_A7_d
- GPIO2_B5_d
- GPIO4_B1_u
- GPIO4_B6_d
- GPIO3_D6_d
- GPIO4_A5_d
- GPIO4_A3_d
- GPIO4_B3_d
- GPIO1_C6_d
- GPIO1_C5_d
- GPIO1_C3_d
- GPIO1_D4_d
- GPIO4_C0_d
- GPIO3_A3_d
- GPIO4_C3_d
- GPIO4_C1_d
- GPIO4_B2_u
- GPIO4_C0_u
- GPIO4_B4_u
- GPIO4_B1_d
- GPIO3_C5_d
- GPIO4_A2_d
- GPIO1_A0_d
- GPIO1_C2_d
- GPIO2_B4_d
- GPIO3_A2_d
- GPIO3_A0_d
- GPIO4_B3_u
- GPIO4_B7_u
- GPIO3_C6_d
- GPIO0_A5_d
- GPIO3_C7_d
- GPIO3_D0_d
- GPIO1_A5_d
- GPIO1_A1_d
- GPIO1_B0_u
- GPIO1_A2_d
- GPIO1_A3_d
- 固态硬盘
- GPIO3_A1_d
- GPIO0_D2_d
- GPIO2_B2_d
- GPIO2_B1_d
- WIFI蓝牙模块
- GPIO2_A6_d
- 图纸名称
- 设计
- 审核
- 工艺
- 版本
- 夏鑫宇
- 批准
- 标准化
- 日期
- 页码
- 第
- 页
- 共
- (in symbol 3588_LEFT_DOWN) FET3576-C; FET3588-C; 3.3V; PWM2_M0; \; PCIE30_PORT1_REFCLKP_IN; PWM4_M0; PCIE30_PORT1_REFCLKN_IN; UART2_TX_M0; UART2_RX_M0; PWM5_M1; GPIO1_B5_u; 1.8V; GPIO1_B4_u; GPIO0_D3_d; GPIO1_B2_d; I2C7_SCL_M0; I2C7_SDA_M0; I2S0_SDO0; GPIO1_C6_d; I2S0_LRCK; I2S0_SCLK; I2S0_SDI0; GPIO4_B1_d; GPIO1_D3_d; PCIE20_1_REFCLKN; I2S0_MCLK; PCIE20_1_REFCLKP; SPI1_MISO_M2; SPI4_MISO_M2; PCIE20_1_RXN; GPIO4_C1_d; GPIO1_A5_d; PCIE20_1_RXP; UART6_TX_M1; GPIO1_B0_u; PCIE20_1_TXN; SPI1_CLK_M2; SPI4_CLK_M2; PCIE20_1_TXP; SPI1_CSN0_M2; SPI4_CS0_M2; USB3_HOST1_SSTXP; USB3_HOST1_SSTXN; USB3_HOST1_SSRXP; USB3_HOST1_SSRXN
- (in symbol 3588_LEFT_UP) FET3576-C; FET3588-C; GPIO3_C0_d; 3.3V; \; GMAC1_MDIO; GMAC1_MDC; GPIO3_B7_d; 1.8V; GMAC0_TXD3; GMAC0_TXD2; GMAC0_TXD1; GMAC0_TXD0; GPIO3_D3_d; GMAC0_TXEN; GPIO3_D2_d; GMAC0_TXCLK; UART9_TX_M2; UART9_RX_M2; GMAC0_RXD3; GMAC0_RXD2; GMAC0_RXD1; GPIO4_A4_d; GPIO3_C5_u; GMAC0_RXD0; GPIO4_A6_d; GPIO3_C4_u; GMAC0_RXDV_CRS; GPIO3_C7_u; GMAC0_RXCLK; GPIO2_D6_d; GPIO3_A6_d; GPIO2_D7_d; GPIO3_B6_d; GPIO2_C4_d; GPIO3_A1_u; GPIO3_B2_d; GPIO2_C3_d; GPIO3_A0_u; GPIO2_C7_d; GPIO3_B4_u; I2C4_SDA_M1; GPIO2_C6_d; GPIO3_B3_u; I2C4_SCL_M1; GPIO2_D0_d; GPIO3_B5_u; GMAC0_MDIO; GPIO2_C5_d; GPIO3_A4_d; GMAC0_MDC; GPIO2_C1_d; GPIO3_A3_u; GPIO2_C0_d; GPIO3_A2_u; GPIO2_D2_d; GPIO3_B0_u; GPIO2_D1_d; GPIO3_A7_u; GPIO2_D3_d; GPIO3_B1_d; GPIO2_C2_d; GPIO3_A5_d; MIPI_CSI1_RX_D2N; MIPI_CSI1_RX_D2P; MIPI_CSI1_RX_D3N; MIPI_CSI1_RX_D3P; MIPI_CSI1_RX_CLK1N; MIPI_CSI1_RX_CLK1P
- (in symbol 3588_RIGHT_DOWN) FET3576-C; FET3588-C; SDMMC_D1; 1.8V/3.3V; \; SDMMC_D0; SDMMC_CLK; SDMMC_CMD; SDMMC_D3; SDMMC_D2; 1.8V; SARADC_VIN0; SARADC_VIN1; SARADC_VIN3; SARADC_VIN7; 3.3V; GPIO2_B0_d; GPIO4_B1_u; GPIO2_A7_d; GPIO4_B0_d; GPIO4_B6_d; GPIO4_C0_d; GPIO4_C1_d; GPIO3_A3_d; GPIO4_B2_u; HDMI_TX0_SDA_M0; GPIO3_A2_d; GPIO4_B3_u; HDMI_TX0_SCL_M0; I2C5_SCL_M2; I2C5_SDA_M2; GPIO4_A2_d; GPIO4_A1_d; GPIO2_A6_d; GPIO4_A0_d; USB20_HOST1_DP; USB20_HOST1_DM; TYPEC1_USB20_VBUSDET
- (in symbol 3588_RIGHT_UP) FET3576-C; FET3588-C; \; TYPEC0_USB20_VBUSDET; TYPEC0_OTG_DM; TYPEC0_OTG_DP; TYPEC0_SBU1; TYPEC0_SBU2; 1.8V; MIPI_DPHY0_TX_D0N; MIPI_DPHY0_RX_D0P; MIPI_DPHY0_TX_D0P; MIPI_DPHY0_RX_D0N; MIPI_DPHY0_TX_D1N; MIPI_DPHY0_RX_D1P; MIPI_DPHY0_TX_D1P; MIPI_DPHY0_RX_D1N; MIPI_DPHY0_TX_CLKN; MIPI_DPHY0_RX_CLKP; MIPI_DPHY0_TX_CLKP; MIPI_DPHY0_RX_CLKN; MIPI_DPHY0_TX_D2N; MIPI_DPHY0_RX_D2P; MIPI_DPHY0_TX_D2P; MIPI_DPHY0_RX_D2N; MIPI_DPHY0_TX_D3N; MIPI_DPHY0_RX_D3P; MIPI_DPHY0_TX_D3P; MIPI_DPHY0_RX_D3N; 3.3V; GPIO0_A7_u; GPIO0_A4_u; GPIO0_B0_z; GPIO0_B3_z

## Library data of the parts
C1 C2 = 1110205018: 序号: 747; 存货名称: 贴装叠层陶瓷电容; 规格型号: 1206,22uF,25V,±10％,X5R; 禁用: 否; 近三年购买频次: 近三年购买频次.30; Published: 8-Jun-2000; LatestRevisionDate: 17-Jul-2002; LatestRevisionNote: Re-released for DXP Platform.; PackageReference: RAD-0.3; Publisher: Altium Limited; PackageDescription: Radial Cap, Thru-Hole; 2 Leads; 0.3 in Pin Spacing; Value: 22uF/25V; 存货编码: 1110205018; 最近一次购买记录: 2025/1/10; 料号建立日期: 2019/7/2
C141 = 1110211010: 序号: 4743; 存货名称: 贴装铝电解电容; 规格型号: 220uF,16V,6.3*7.7mm,CS1C221M-CRE77; 禁用: 否; 近三年购买频次: 近三年购买频次.19; Published: 8-Jun-2000; LatestRevisionDate: 17-Jul-2002; LatestRevisionNote: Re-released for DXP Platform.; PackageReference: RB7.6-15; Publisher: Altium Limited; PackageDescription: Polarized Capacitor (Radial); 2 Leads; Value: 220μF/16V_DNP; 存货编码: 1110211010; 最近一次购买记录: 2024/12/25; 料号建立日期: 2022/9/2
R1-R6 R9-R12 = 1110102038: 序号: 58; 存货名称: 贴装电阻; 规格型号: 0402,2.2K,±1％; 禁用: 否; 近三年购买频次（更新至2023/12/7）: 近三年购买频次,47; Value: 2.2K_1%; 存货编码: 1110102038; 最近一次购买记录(更新至20231207）: 2023/11/28; 料号建立日期: 2019/7/2
P1 = 3588_RIGHT_DOWN: Value: 3588_RIGHT_DOWN
P2 = 3588_LEFT_DOWN: Value: 3588_LEFT_DOWN
P3 = 3588_RIGHT_UP: Value: 3588_RIGHT_UP
P4 = 3588_LEFT_UP: Value: 3588_LEFT_UP